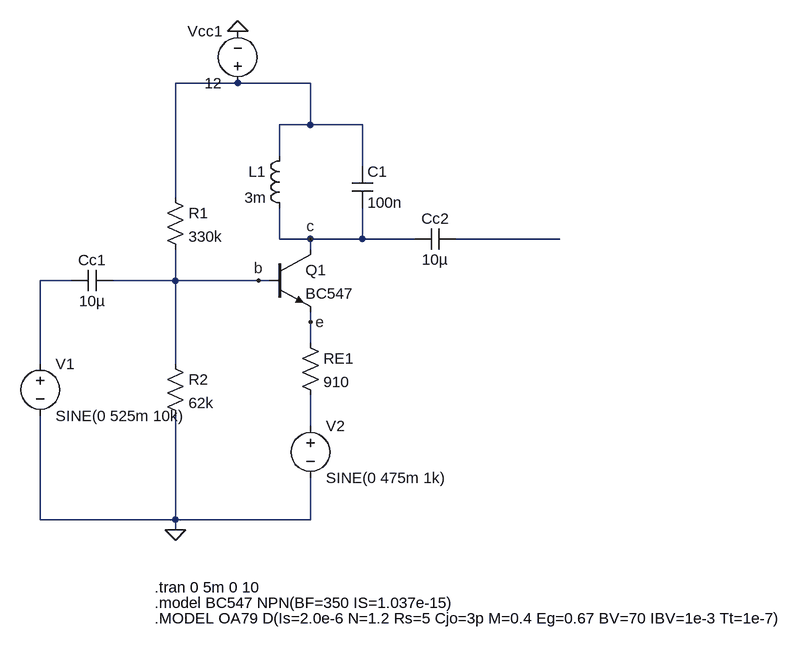
[diagram p0: schematic modulation.asc]
modulation.asc, the LTspice schematic file:
Version 4
SHEET 1 1348 680
WIRE -128 -512 -224 -512
WIRE -16 -512 -128 -512
WIRE -16 -448 -16 -512
WIRE -16 -448 -64 -448
WIRE 64 -448 -16 -448
WIRE -64 -400 -64 -448
WIRE 64 -384 64 -448
WIRE -224 -336 -224 -512
WIRE -64 -272 -64 -320
WIRE -16 -272 -64 -272
WIRE 64 -272 64 -320
WIRE 64 -272 -16 -272
WIRE 144 -272 64 -272
WIRE 368 -272 208 -272
WIRE -16 -256 -16 -272
WIRE -384 -208 -432 -208
WIRE -224 -208 -224 -256
WIRE -224 -208 -320 -208
WIRE -96 -208 -224 -208
WIRE -80 -208 -96 -208
WIRE -16 -144 -16 -160
WIRE -16 -112 -16 -144
WIRE -432 -80 -432 -208
WIRE -224 -80 -224 -208
WIRE -16 16 -16 -32
WIRE -432 160 -432 0
WIRE -224 160 -224 0
WIRE -224 160 -432 160
WIRE -16 160 -16 96
WIRE -16 160 -224 160
WIRE -224 176 -224 160
FLAG -128 -592 0
FLAG -224 176 0
FLAG -16 -272 c
FLAG -96 -208 b
FLAG -16 -144 e
SYMBOL ind -48 -416 M0
SYMATTR InstName L1
SYMATTR Value 3m
SYMBOL npn -80 -256 R0
SYMATTR InstName Q1
SYMATTR Value BC547
SYMBOL voltage -128 -496 R180
WINDOW 0 24 96 Left 2
WINDOW 3 24 16 Left 2
SYMATTR InstName Vcc1
SYMATTR Value 12
SYMBOL res -240 -352 R0
SYMATTR InstName R1
SYMATTR Value 330k
SYMBOL res -240 -96 R0
SYMATTR InstName R2
SYMATTR Value 62k
SYMBOL res -32 -128 R0
SYMATTR InstName RE1
SYMATTR Value 910
SYMBOL cap 48 -384 R0
SYMATTR InstName C1
SYMATTR Value 100n
SYMBOL voltage -432 -96 R0
WINDOW 123 0 0 Left 0
WINDOW 39 0 0 Left 0
SYMATTR InstName V1
SYMATTR Value SINE(0 525m 10k)
SYMBOL voltage -16 0 R0
WINDOW 123 0 0 Left 0
WINDOW 39 0 0 Left 0
SYMATTR InstName V2
SYMATTR Value SINE(0 475m 1k)
SYMBOL cap -320 -224 R90
WINDOW 0 0 32 VBottom 2
WINDOW 3 32 32 VTop 2
SYMATTR InstName Cc1
SYMATTR Value 10µ
SYMBOL cap 208 -288 R90
WINDOW 0 0 32 VBottom 2
WINDOW 3 32 32 VTop 2
SYMATTR InstName Cc2
SYMATTR Value 10µ
TEXT -256 264 Left 2 !.tran 0 5m 0 10
TEXT -256 288 Left 2 !.model BC547 NPN(BF=350 IS=1.037e-15)
TEXT -256 312 Left 2 !.MODEL OA79 D(Is=2.0e-6 N=1.2 Rs=5 Cjo=3p M=0.4 Eg=0.67 BV=70 IBV=1e-3 Tt=1e-7)

The netlist it stands for:
* modulation.asc
L1 N001 c 3m
Q1 c b e 0 BC547
Vcc1 N001 0 12
R1 N001 b 330k
R2 b 0 62k
RE1 e N004 910
C1 N001 c 100n
V1 N003 0 SINE(0 525m 10k)
V2 N004 0 SINE(0 475m 1k)
Cc1 b N003 10µ
Cc2 N002 c 10µ
.model NPN NPN
.model PNP PNP
.lib standard.bjt
.tran 0 5m 0 10
.model BC547 NPN(BF=350 IS=1.037e-15)
.MODEL OA79 D(Is=2.0e-6 N=1.2 Rs=5 Cjo=3p M=0.4 Eg=0.67 BV=70 IBV=1e-3 Tt=1e-7)
.backanno
.end